# EAGLE design balancer (EAGLE 9.6.2)
SCHEMATIC_VERSION: V1.1
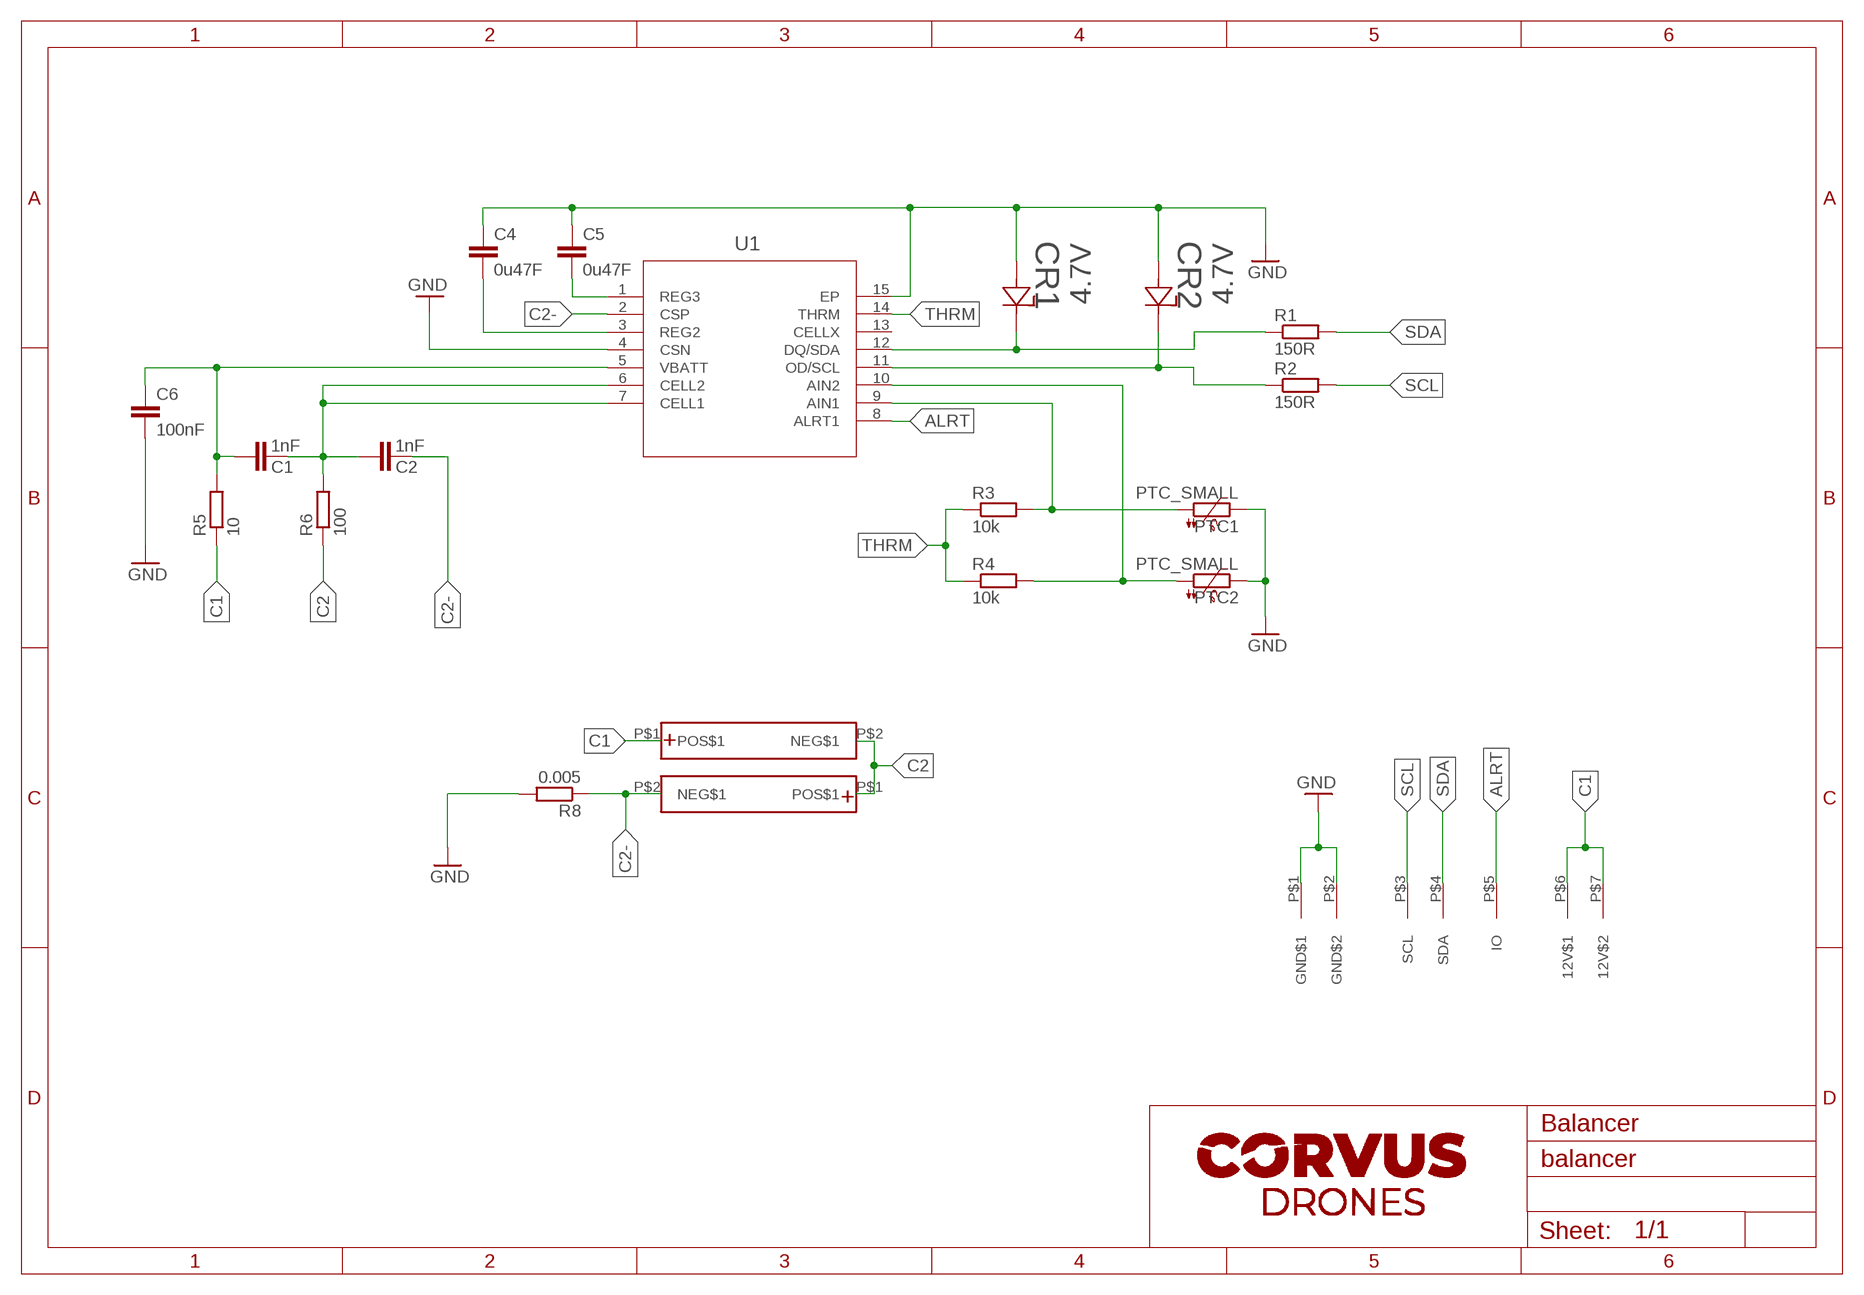
[diagram p0: schematic, sheet 1]

## Parts
C1  1nF  C_0603_1N  [C0603]
C2  1nF  C_0603_1N  [C0603]
C4  0u47F  C_0603_0U47  [C0603]
C5  0u47F  C_0603_0U47  [C0603]
C6  100nF  C_0603_100N  [C0603]
CR1  4u7 ZEN  ZENER-SOD323SOD323_NEX-L  [SOD323_NEX-L]
CR2  4u7 ZEN  ZENER-SOD323SOD323_NEX-L  [SOD323_NEX-L]
PTC1  PTC_SMALL  [P660]
PTC2  PTC_SMALL  [P660]
R1  150R  R_0603_150R  [R0603]
R2  150R  R_0603_150R  [R0603]
R3  10k  R_0603_10K  [R0603]
R4  10k  R_0603_10K  [R0603]
R5  10  R_1206_10R  [R1206]
R6  100  R_1206_10R  [R1206]
R8  0.005  R-EU_R4527  [R4527]
U1  MAX17205G+  MAX17205G+TDFN-15  [TDFN-15]
U$1  BATT_CELL  [BATT_CELL]
U$2  BATT_CELL  [BATT_CELL]
U$4  BATT_CON_THT  [BATT_CON_THT]

## Nets
ALRT: U1.8(ALRT1) U$4.P$5(IO)
C1: R5.1 U$1.P$1(POS$1) U$4.P$6(12V$1) U$4.P$7(12V$2)
C2: R6.1 U$1.P$2(NEG$1) U$2.P$1(POS$1)
C2-: C2.1 R8.1 U1.2(CSP) U$2.P$2(NEG$1)
GND: C4.1 C5.1 C6.2 CR1.2 CR2.2 PTC1.2 PTC2.2 R8.2 U1.4(CSN) U1.15(EP) U$4.P$1(GND$1) U$4.P$2(GND$2)
N$7: CR1.1 R1.1 U1.12(DQ/SDA)
N$8: CR2.1 R2.1 U1.11(OD/SCL)
N$10: PTC2.1 R4.2 U1.10(AIN2)
N$11: PTC1.1 R3.2 U1.9(AIN1)
N$12: C5.2 U1.1(REG3)
N$13: C4.2 U1.3(REG2)
N$15: C1.1 C2.2 R6.2 U1.6(CELL2) U1.7(CELL1)
N$16: C1.2 C6.1 R5.2 U1.5(VBATT)
SCL: R2.2 U$4.P$3(SCL)
SDA: R1.2 U$4.P$4(SDA)
THRM: R3.1 R4.1 U1.14(THRM)
Unconnected: U1.13(CELLX)

## Library data of the parts
C1 C2 C4 C5 = corvus_RC:C_0603
C6 = corvus_RC:C_0603; FARNELL: 2320813
CR1 CR2 = corvus_parts:ZENER-SOD323; FARNELL: 3868843; ZENER_VOLT: 4.7V
PTC1 PTC2 = corvus_parts:PTC_SMALL
R1-R4 = corvus_RC:R_0603
R5 R6 = corvus_RC:R_1206
R8 = rcl_CUSTOM:R-EU_: RESISTOR, European symbol; SPICEPREFIX: R
U1 = corvus_chips:MAX17205G+; DIGIKEY: MAX17205G+TTR-ND; FARNELL: 2535468; MOUSSER: 700-MAX17205G+T
U$1 U$2 = corvus_parts:BATT_CELL
U$4 = corvus_parts:BATT_CON_THT

## Board
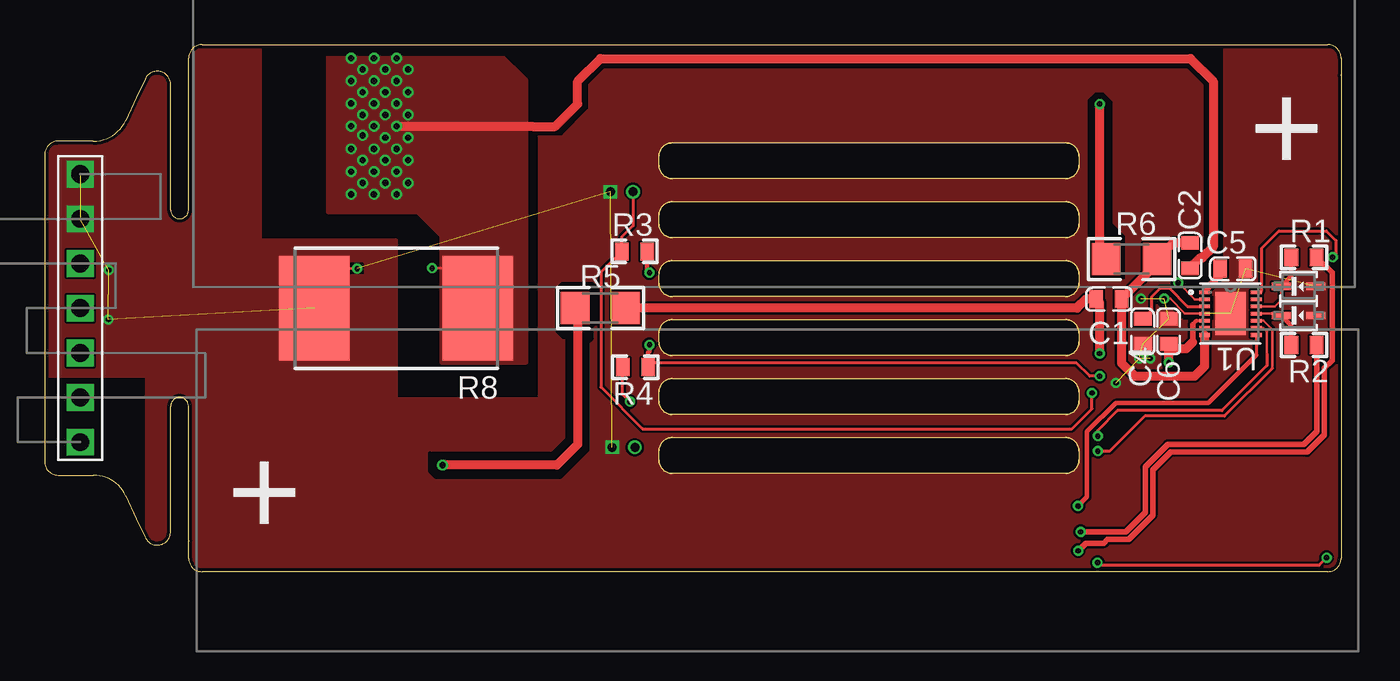
[diagram p1: board, top side]
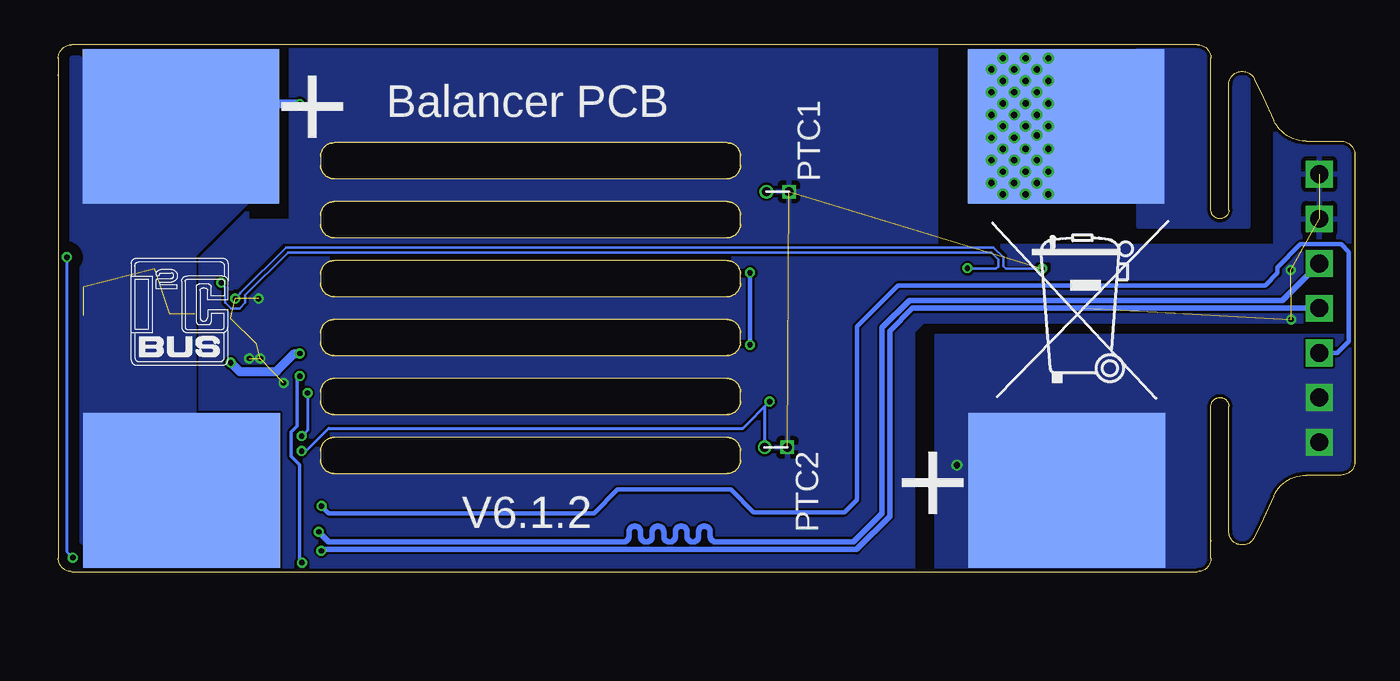
[diagram p2: board, bottom side, seen from below]

Size 72.55 x 29.5 mm. Coordinates in mm from the lower left corner, seen from the top.
Outline: 72.55,27.75 72.55,28.75 arc90 71.8,29.5 8.8,29.5 arc90 8.05,28.75 8.05,20.25 arc-180 7.05,20.25 7.05,27.26
Outline: 7.05,27.26 arc0 7.05,27.26
Outline: 7.05,27.26 7.05,27.33 arc73 6.45,27.99 arc77 5.62,27.58 5.13,26.54 4.54,25.26 4.54,25.25 arc-65 2.72,24.1 0.75,24.1 0.68,24.1 arc85 0,23.35 0,6.15 arc90 0.75,5.4 2.73,5.4 arc-5 2.9,5.39
Outline: 2.9,5.39 2.9,5.39
Outline: 2.9,5.39 arc-60 4.54,4.24 5.13,2.96 5.62,1.92 arc155 7.05,2.24 7.05,9.25 arc-180 8.05,9.25 8.05,1.75
Outline: 8.05,1.75 8.05,1.69
Outline: 8.05,1.75 8.05,0.75 arc90 8.8,0 71.8,0 arc90 72.55,0.75 72.55,27.75
Outline: 72.55,27.75 72.55,27.81
Copper layers (1*16): Top 0.035mm / dielectric 0.8mm / Bottom 0.035mm
Design rules "JLCPCB": minimum track width 5mil, minimum drill 0.2mm, track to track 5mil, track to pad 0.2mm, pad to pad 6mil, via to via 10mil, smd to smd 5mil, copper to edge 0.2mm, drill to drill 10mil, minimum pad ring 0.13mm, minimum via ring 0.13mm, stop-mask expansion 0.05mm, vias tented up to drill 15mil, thermal gap 10mil
tRestrict: 96 lines
bRestrict: 96 lines
Milling: area 34.4,22 to 57.9,24; area 34.4,18.7 to 57.9,20.7; area 34.4,15.4 to 57.9,17.4; area 34.4,12.1 to 57.9,14.1; area 34.4,8.8 to 57.9,10.8; area 34.4,5.5 to 57.9,7.5; 96 lines

### Footprints (pad centres in the part's own frame; a part is rotated, then mirrored left to right if it is on the bottom)
C0603 = smd 0.762 x 1.001: 1 -0.711,0; 2 0.711,0
SOD323_NEX-L = smd 1.054 x 0.406: 1 -0.972,0; 2 0.972,0
P660 = drill 0.5: 1 -1.27,0 | drill 0.5 square: 2 0,0
R0603 = smd 0.762 x 1.001: 1 -0.711,0; 2 0.711,0
R1206 = smd 1.6 x 1.803: 1 -1.422,0; 2 1.422,0
R4527 = smd 3.94 x 5.84: 1 -4.575,0; 2 4.575,0
TDFN-15 = smd 0.61 x 0.203: 1 -1.448,1.2; 2 -1.448,0.8; 3 -1.448,0.4; 4 -1.448,0; 5 -1.448,-0.4; 6 -1.448,-0.8; 7 -1.448,-1.2; 8 1.448,-1.2; 9 1.448,-0.8; 10 1.448,-0.4; 11 1.448,0; 12 1.448,0.4; 13 1.448,0.8; 14 1.448,1.2 | smd 1.702 x 2.388: 15 0,0
BATT_CELL = smd 11 x 8.644 bottom: P$1 7.62,9; P$2 57.15,9
BATT_CON_THT = drill 1 square: P$1 -7.498,0; P$2 -4.998,0; P$3 -2.498,0; P$4 0.002,0; P$5 2.502,0; P$6 5.002,0; P$7 7.502,0

### Placement (x,y rotation side)
C1  59.55,15.26 180 top
C2  64.09,17.7 90 top
C4  61.45,13.45 90 top
C5  66.48,16.96 180 top
C6  62.9,13.45 90 top
CR1  70.17,15.97 0 top
CR2  70.17,14.34 0 top
PTC1  31.66,21.27 0 bottom
PTC2  31.75,6.96 0 bottom
R1  70.47,17.59 0 top
R2  70.47,12.69 0 top
R3  33,17.93 180 top
R4  33.06,11.45 180 top
R5  31.1,14.75 0 top
R6  60.82,17.49 0 top
R8  19.67,14.75 180 top
U1  66.36,14.45 0 top
U$1  8.49,-4.45 0 top
U$2  73.31,33.93 180 top
U$4  1.98,14.75 270 top
U$5  [I2C]  68.49,11.52 0 bottom
U$6  [MUELLTONNE_10.00]  20.94,9.29 0 bottom

### Tracks (layer width: path | path; a pad name or v marks a point on that pad's centre or on a via)
ALRT  (via drill 0.3)
  Top 0.178: U1.8 67.8,12.13
  Top 0.254: 67.8,12.13 65.11,9.44 59.93,9.44 58.33,7.84 58.33,4.18 v57.82,3.68
  Bottom 0.254: v57.82,3.68 57.41,3.27 42.58,3.27 41.26,4.59 34.91,4.59 33.64,3.32 28.56,3.32 27.87,4.01 27.87,13.71 25.56,16.02 5.01,16.02 4.33,16.71 4.33,17.04 3.04,18.32 0.77,18.32 0.33,17.89 0.33,12.9 0.97,12.25 U$4.P$5
C1  (via drill 0.35)
  Top 0.508: R5.1 29.83,14.6 29.83,7.13 28.66,5.96 v22.26,5.96
  pour Bottom (rank 5, no thermals): -5.73,4.59 -5.73,-1.76 22.21,-1.76 22.21,10.94 10.78,10.94 9.51,12.21 8.9,12.82 8.32,12.82 5.73,12.82 5.14,12.24 5.14,11.37 5.01,11.24 4.71,10.94 -0.65,10.94 -5.73,10.94
  pour Bottom: -3.23,13.23 23.48,13.23 23.48,-1.76 -1.98,-1.76
C2  (via drill 0.3)
  Top 0.508: R6.1 59.04,17.85 v59.04,26.18
  Bottom 0.508: v59.04,26.18 64.44,26.18 U$2.P$1 | U$1.P$2 65.69,4.5 65.69,4.31
  Bottom 7.62: 65.69,4.31 65.39,4.01
  pour Bottom (isolate 0.61, rank 4, no thermals): 60.63,22.05 64.96,17.72 64.96,-0.11 73.8,-0.11 73.8,30.27
C2-  (via drill 0.3, 0.35)
  Top 0.127: 24.47,16.98 24.52,16.93 24.52,15.03 R8.1
  Top 0.152: U1.2 64.36,15.24 v63.43,16.17 | v21.68,16.98 24.47,16.98
  Top 0.508: v19.69,24.94 27.26,24.94 27.29,24.91 28.56,24.91 29.83,26.18 29.83,27.45 31.1,28.72 64.12,28.72 65.39,27.45 65.39,18.18 64.78,17.57 64.68,17.57 C2.1
  Bottom 0.127: 21.65,16.96 v21.68,16.98
  Bottom 0.152: v63.43,16.17 63.21,15.94 63.21,15.06 62.88,14.73 62.42,14.73 62.09,15.06 62.09,15.49 59.7,17.87 20.34,17.87 19.95,17.48 19.95,17.09 20.08,16.96 21.65,16.96
  Bottom 0.178: U$2.P$2 16.16,25.21 v17.15,26.2
  other vias: 19.7,21.13 19.7,22.4 19.7,23.67 19.7,26.21 19.7,27.48 19.7,28.75 18.43,28.75 18.43,27.48 18.43,26.21 18.43,24.94 18.43,23.67 18.43,22.4 18.43,21.13 17.16,21.13 17.16,22.4 17.16,23.67 17.16,24.94 17.16,27.48 17.16,28.75 17.79,28.11 19.06,28.11 20.33,28.11 20.33,26.84 19.06,26.84 17.79,26.84 17.79,25.57 17.79,24.43 17.79,23.03 17.79,21.76 19.06,21.76 19.06,23.03 19.06,24.3 19.06,25.57 20.33,25.57 20.33,24.3 20.33,23.03 20.33,21.76
  pour Top (isolate 0.61, no thermals): 15.86,29 15.86,20.13 20.89,20.13 22.21,18.81 22.21,11.7 26.93,11.7 26.93,27.5 25.44,29
  pour Bottom (rank 5, no thermals): 5.95,29.99 12.13,29.99 12.13,19.32 5.95,19.32
GND  (via drill 0.3)  (16 unrouted)
  Top 0.127: R8.2 15.09,15.38 16.67,16.96
  Top 0.152: U1.4 63.81,14.45 62.98,15.28 v62.65,15.28 | v17.49,16.96 16.67,16.96
  Bottom 0.152: v62.65,15.28 62.37,15.56 62.37,15.6 59.82,18.15 20.21,18.15 19.67,17.61 19.67,17.11 19.52,16.96 v17.49,16.96
  other vias: 3.59,16.88 3.57,14.12 61.35,15.28 59.95,10.56 61.86,11.93 61.25,11.93
  pour Top (no thermals): -3.19,32.53 -3.19,10.94 5.7,10.94 5.7,-3.03 74.28,-3.03 74.28,31.26 27.7,31.26 27.7,9.67 19.67,9.67 19.67,18.56 12.05,18.56 12.05,32.53
  pour Bottom (rank 6): -3.19,14.75 -3.19,19.83 -1.92,21.1 -1.92,22.37 0.62,24.91 4.43,24.91 4.43,18.2 23.48,18.2 23.48,32.53 75.55,32.53 75.55,-1.76 74.28,-3.03 27.29,-3.03 24.75,-0.49 24.75,13.48 24.19,14.04 -2.48,14.04
  cutout Top: 21.57,6.62 21.57,5.63 21.91,5.3 28.84,5.3 30.39,6.85 30.39,12.85 30.59,13.05 30.59,13.76 30.87,14.04 30.87,15.84 30.62,16.1 28.97,16.1 28.66,15.79 28.66,13.51 29.04,13.12 29.25,13.12 29.25,7.43 28.41,6.6 21.6,6.6
  cutout Top: 58.38,26.38 58.38,16.4 60.44,16.4 60.44,18.76 59.75,19.45 59.75,26.28 59.24,26.79 58.79,26.79
  cutout Top: 63.71,14.14 65.39,14.14 65.39,15.41 64.42,15.41 63.94,15.89 63.94,16.17 63.69,16.43 63.31,16.43 63.03,16.15 63.03,16.07 62.93,15.97 62.55,15.97 62.27,15.69 62.21,15.69 62.21,15.08 62.44,14.85 63,14.85
  cutout Bottom: 60.31,29.99 60.31,20.87 60.34,20.85 61.83,20.85 61.83,19.8 59.65,19.8 59.65,29.89
  cutout Bottom: 53.68,17.98 59.8,17.98 62.27,15.51 62.27,15 62.37,14.9 62.88,14.9 63,15.03 63.08,15.03 63.03,15.08 63.03,15.46 62.8,15.69 62.77,15.69 62.67,15.79 62.49,15.79 59.95,18.33 20.1,18.33 19.49,17.72 19.49,17.09 17.97,17.09 17.76,17.29 17.1,17.29 17.05,17.24 17.05,16.83 17.45,16.44 17.79,16.78 19.9,16.78 19.9,17.7 20.15,17.95 52.89,17.95 52.92,17.93
  cutout Top: 17.13,17.29 17.76,17.29 17.82,17.24 17.82,16.66 17.03,16.66 16.98,16.71 16.98,17.24
  cutout Top: 27.29,22.9 27.29,24.43 27.24,24.48 28.79,24.48 28.81,24.5 28.92,24.5 30.36,25.95 30.36,27.2 30.31,27.25 31.3,28.24 63.94,28.24 64.93,27.25 64.93,18.43 64.78,18.28 64.96,18.28 65.62,17.62 65.87,17.62 65.87,30.14 27.29,30.14
N$7
  Top 0.152: U1.12 68.83,14.85 69.19,15.21 CR1.1
  Top 0.254: CR1.1 69.76,16.53 R1.1
N$8
  Top 0.152: U1.11 69.09,14.45 CR2.1
  Top 0.254: CR2.1 69.76,13.78 R2.1
N$10  (via drill 0.3)
  Top 0.152: U1.10 68.21,14.04 68.69,13.56 68.69,11.4
  Top 0.178: 68.69,11.4 68.69,11.37 66.03,8.71 61.55,8.71 59.6,6.75 v58.94,6.75 | v32.75,9.51 32.34,9.92 R4.2
  Bottom 0.178: v58.94,6.75 58.68,6.75 57.41,8.02 34.24,8.02 v32.75,9.51 33.02,9.24 PTC2.1
N$11  (via drill 0.3)
  Top 0.152: U1.9 68.2,13.64 68.39,13.46 68.39,12.21
  Top 0.178: v58.94,7.59 58.94,7.92 60.03,9.01 65.87,9.01 68.39,11.53 68.39,12.21 | v58.61,10 58.61,9.11 57.49,7.99 33.46,7.99 31.12,10.33 31.12,16.76 R3.2 32.29,18.74 32.93,19.37 PTC1.1
  Bottom 0.178: v58.94,7.59 58.61,7.92 v58.61,10
N$12
  Top 0.178: U1.1 64.96,15.64 64.96,15.8
  Top 0.381: 65.77,16.61 64.96,15.8
  Top 0.508: C5.2 65.77,16.61
N$13
  Top 0.178: C4.2 61.96,14.67 61.96,15.41 62.42,15.87 62.92,15.87 63.94,14.85 U1.3
N$15
  Top 0.178: U1.6 U1.7
  Top 0.508: C2.2 63.15,18.41 R6.2 62.24,17.24 C1.1 60.26,11.68 61,10.94 64.35,10.94 64.91,11.5 U1.7
N$16  (via drill 0.3)
  Top 0.178: 64.46,14.04 U1.5
  Top 0.229: 64.25,13.84 64.46,14.04
  Top 0.305: 64.25,12.85 64.25,13.84
  Top 0.508: R5.2 57.77,14.75 58.28,15.26 C1.2 59.04,15.05 v59.04,12.21 | v62.9,11.7 62.88,11.73 62.88,12.72 C6.1 63.18,12.46 63.87,12.46 64.25,12.85
  Bottom 0.508: v62.9,11.7 62.39,11.19 60.36,11.19 59.34,12.21 v59.04,12.21
SCL  (via drill 0.3)
  Top 0.305: R2.2 71.18,7.84 70.47,7.13 62.85,7.13 61.58,5.86 61.58,3.32 60.49,2.23 v57.97,2.23
  Bottom 0.305: U$4.P$3 4.05,15.18 24.93,15.18 26.45,13.66 26.45,3.27 28.05,1.67 35.76,1.67 arc90 36.07,1.98 36.07,2.24 arc-90 36.38,2.55 36.41,2.55 arc-90 36.72,2.24 36.72,1.98 arc90 37.03,1.67 37.06,1.67 arc90 37.37,1.98 37.37,2.24 arc-90 37.68,2.55 37.71,2.55 arc-90 38.02,2.24 38.02,1.98 arc90 38.33,1.67 38.36,1.67 arc90 38.67,1.98 38.67,2.24 arc-90 38.98,2.55 39.01,2.55 arc-90 39.32,2.24 39.32,1.98 arc90 39.63,1.67 39.66,1.67 arc90 39.97,1.98 39.97,2.24 arc-90 40.28,2.55 40.31,2.55 arc-90 40.62,2.24 40.62,1.98 arc90 40.93,1.67 57.41,1.67 v57.97,2.23
SDA  (via drill 0.3)
  Top 0.305: R1.2 72.04,16.73 72.04,11.82 71.61,11.39 71.61,7.66 70.65,6.7 63.03,6.7 62.01,5.68 62.01,3.14 60.67,1.8 59.48,1.8 59.28,1.6 58.26,1.6 v57.83,1.17
  Bottom 0.305: U$4.P$4 24.75,14.75 26.02,13.48 26.02,3.09 27.87,1.24 57.76,1.24 v57.83,1.17
THRM  (via drill 0.3)
  Top 0.178: U1.14 68.03,15.64 68.11,15.72 68.11,18.1 69.07,19.07 71.73,19.07 72.26,18.54 72.26,17.79 v72.07,17.6 | v59.04,10.94 58.48,10.94 57.74,11.68 34,11.68 R4.1 | v71.74,0.78 71.31,0.35 59.06,0.35 v58.91,0.5
  Top 0.254: R3.1 33.72,16.86 v33.84,16.73 | v33.84,12.69 33.84,12.34 33.77,12.26 R4.1
  Bottom 0.178: v72.07,17.6 72.07,1.11 v71.74,0.78
  Bottom 0.203: v58.91,0.5 59.04,0.63 59.04,5.96 59.52,6.44 59.52,7.83 59.19,8.16 59.19,10.79 v59.04,10.94
  Bottom 0.254: v33.84,16.73 v33.84,12.69

### Text on the board
bPlace: Balancer PCB | + | +